# Altium project SRD-12VDC-SL-C.PrjPcb
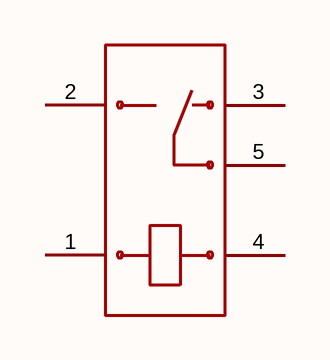
[diagram p0: SRD-12VDC-SL-C.schdoc]
1 sheet, 1 parts. Net scope: global (net labels, ports and power ports of the same name join across sheets).

## Sheet SRD-12VDC-SL-C.schdoc
size 127 x 101 mm

### Parts
RELAY?  srd-12vdc-sl-c  [RELAY-TH_SRD-XXVDC-XL-C]  (value not drawn)

### Nets

Not connected (* = marked no-connect by the designer): RELAY? 1 2 3 4 5

### Library data of the parts
RELAY? = srd-12vdc-sl-c: 线圈电压:12V;触点形式:一组转换:1C(单刀双掷-转换);触点容量(电阻负载):-;最大切换电压:250V@AC;最大切换电流:15A;; Manufacturer: 松乐; AddInBom: yes; ModelId: d0eda9b8bf8746d18ae810ab88dc78e7; ModelName: RELAY-TH_L19.2-W15.6-H15.8; ModelTransform: 755.904,622.4397,0,0,0,0,34.882,0,-118.11; Coil Voltage: 12V; Coil Rated Power: 360mW; Switching Current(Max): 15A; Coil Type: 无极性-单线圈; Coil Resistance: 400Ω; Contact Resistance: 100mΩ; Operate Time: 10ms; Symbol: SRD-12VDC-SL-C; LCSC Part Name: 单组转换型继电器; SupplierPart: C30431; ManufacturerPart: SRD-12VDC-SL-C; Supplier Footprint: 插件,19.2x15.6mm; JLCPCB Part Class: Extended Part; Datasheet: https://item.szlcsc.com/datasheet/SRD-12VDC-SL-C/31188.html; Supplier: LCSC; ConvertToPcb: yes; FootprintName: RELAY-TH_SRD-XXVDC-XL-C; Contact Form: 一组转换:1C(单刀双掷-转换); Number of Pins: 5; Contact Rating: -; Switching Voltage(Max): 250V@AC; Release Time: 10ms; Length: 19.2mm; Width: 15.6mm; Height: 15.8mm